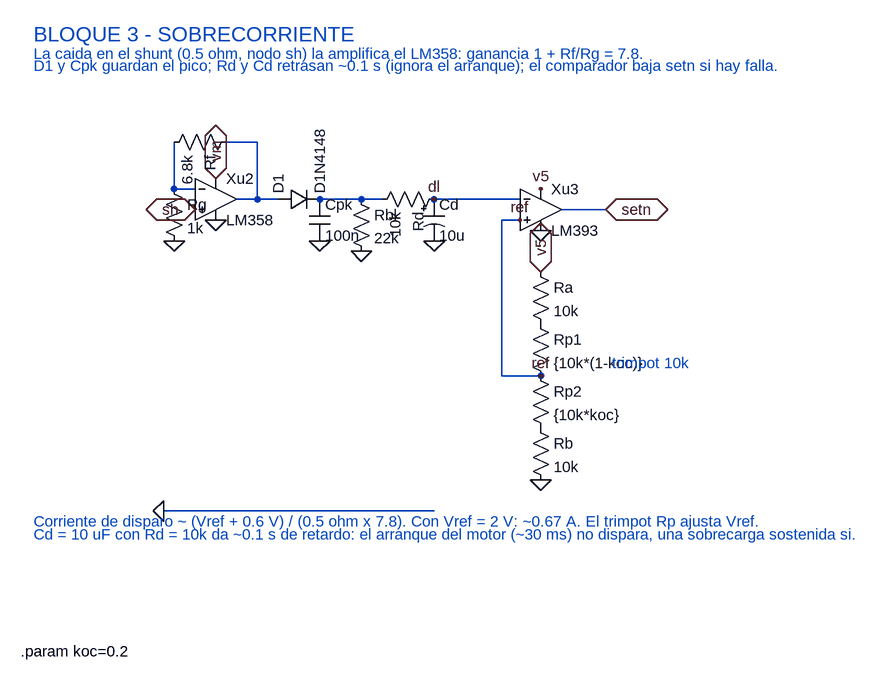
[diagram p0: schematic BLOQUE_SOBRECORRIENTE.asc]
BLOQUE_SOBRECORRIENTE.asc, the LTspice schematic file:
Version 4
SHEET 1 1400 900
WIRE 168 48 136 48
WIRE 136 48 136 -24
WIRE 216 -24 264 -24
WIRE 264 -24 264 64
WIRE 264 64 232 64
WIRE 264 64 296 64
WIRE 360 64 424 64
WIRE 424 64 456 64
WIRE 536 64 668 64
WIRE 732 80 800 80
WIRE 700 336 640 336
WIRE 640 336 640 96
WIRE 640 96 668 96
WIRE 120 544 536 544
FLAG 168 80 sh
FLAG 200 32 vm
FLAG 200 96 0
FLAG 136 128 0
FLAG 360 128 0
FLAG 424 144 0
FLAG 536 128 0
FLAG 536 64 dl
FLAG 668 96 ref
FLAG 700 48 v5
FLAG 700 112 0
FLAG 800 80 setn
FLAG 700 176 v5
FLAG 700 336 ref
FLAG 700 496 0
FLAG 120 544 0
IOPIN 168 80 BiDir
IOPIN 200 32 BiDir
IOPIN 800 80 BiDir
IOPIN 700 176 BiDir
SYMBOL OpAmps\opamp2 200 0 R0
SYMATTR InstName Xu2
SYMATTR Value LM358
SYMBOL res 120 32 R0
SYMATTR InstName Rg
SYMATTR Value 1k
SYMBOL res 232 -40 R90
SYMATTR InstName Rf
SYMATTR Value 6.8k
SYMBOL diode 296 80 R270
SYMATTR InstName D1
SYMATTR Value D1N4148
SYMBOL cap 344 64 R0
SYMATTR InstName Cpk
SYMATTR Value 100n
SYMBOL res 408 48 R0
SYMATTR InstName Rbl
SYMATTR Value 22k
SYMBOL res 552 48 R90
SYMATTR InstName Rd
SYMATTR Value 10k
SYMBOL polcap 520 64 R0
SYMATTR InstName Cd
SYMATTR Value 10u
SYMBOL OpAmps\opamp2 700 16 R0
SYMATTR InstName Xu3
SYMATTR Value LM393
SYMBOL res 684 160 R0
SYMATTR InstName Ra
SYMATTR Value 10k
SYMBOL res 684 240 R0
SYMATTR InstName Rp1
SYMATTR Value {10k*(1-koc)}
SYMBOL res 684 320 R0
SYMATTR InstName Rp2
SYMATTR Value {10k*koc}
SYMBOL res 684 400 R0
SYMATTR InstName Rb
SYMATTR Value 10k
TEXT -80 -190 Left 3 ;BLOQUE 3 - SOBRECORRIENTE
TEXT -80 -160 Left 2 ;La caida en el shunt (0.5 ohm, nodo sh) la amplifica el LM358: ganancia 1 + Rf/Rg = 7.8.
TEXT -80 -142 Left 2 ;D1 y Cpk guardan el pico; Rd y Cd retrasan ~0.1 s (ignora el arranque); el comparador baja setn si hay falla.
TEXT 810 316 Left 2 ;trimpot 10k
TEXT -80 560 Left 2 ;Corriente de disparo ~ (Vref + 0.6 V) / (0.5 ohm x 7.8). Con Vref = 2 V: ~0.67 A. El trimpot Rp ajusta Vref.
TEXT -80 580 Left 2 ;Cd = 10 uF con Rd = 10k da ~0.1 s de retardo: el arranque del motor (~30 ms) no dispara, una sobrecarga sostenida si.
TEXT -100 760 Left 2 !.param koc=0.2

The netlist it stands for:
* BLOQUE_SOBRECORRIENTE.asc
XXu2 sh N001 vm 0 N002 LM358  ; pins In+ In- V+ V- OUT
Rg N001 0 1k
Rf N002 N001 6.8k
D1 N002 N003 D1N4148
Cpk N003 0 100n
Rbl N003 0 22k
Rd dl N003 10k
Cd dl 0 10u
XXu3 ref dl v5 0 setn LM393  ; pins In+ In- V+ V- OUT
Ra v5 P001 10k
Rp1 P001 ref {10k*(1-koc)}
Rp2 ref P002 {10k*koc}
Rb P002 0 10k
.model D D
.lib standard.dio
* BLOQUE 3 - SOBRECORRIENTE
* La caida en el shunt (0.5 ohm, nodo sh) la amplifica el LM358: ganancia 1 + Rf/Rg = 7.8.
* D1 y Cpk guardan el pico; Rd y Cd retrasan ~0.1 s (ignora el arranque); el comparador baja setn si hay falla.
* trimpot 10k
* Corriente de disparo ~ (Vref + 0.6 V) / (0.5 ohm x 7.8). Con Vref = 2 V: ~0.67 A. El trimpot Rp ajusta Vref.
* Cd = 10 uF con Rd = 10k da ~0.1 s de retardo: el arranque del motor (~30 ms) no dispara, una sobrecarga sostenida si.
.param koc=0.2
.backanno
.end